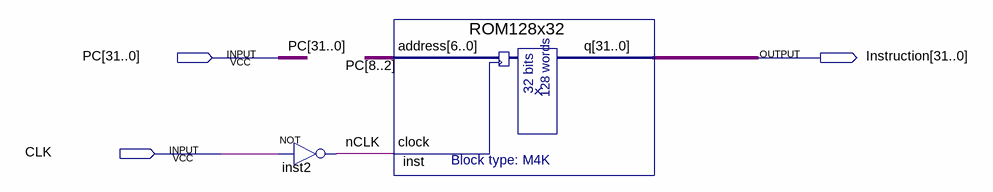
[diagram p0: schematic sheet]
// Quartus schematic IMem.bdf as structural Verilog: 2 symbols, 3 pins
module IMem (
  input  [31:0] PC,
  input  CLK,
  output [31:0] Instruction
);

  wire nCLK;

  not inst2 (nCLK, CLK);
  ROM128x32 inst (.address(PC[8:2]), .clock(nCLK), .q(Instruction));
endmodule
